# Altium schematic sheet CH32X035F8U-R0.SchDoc
size 304 x 254 mm
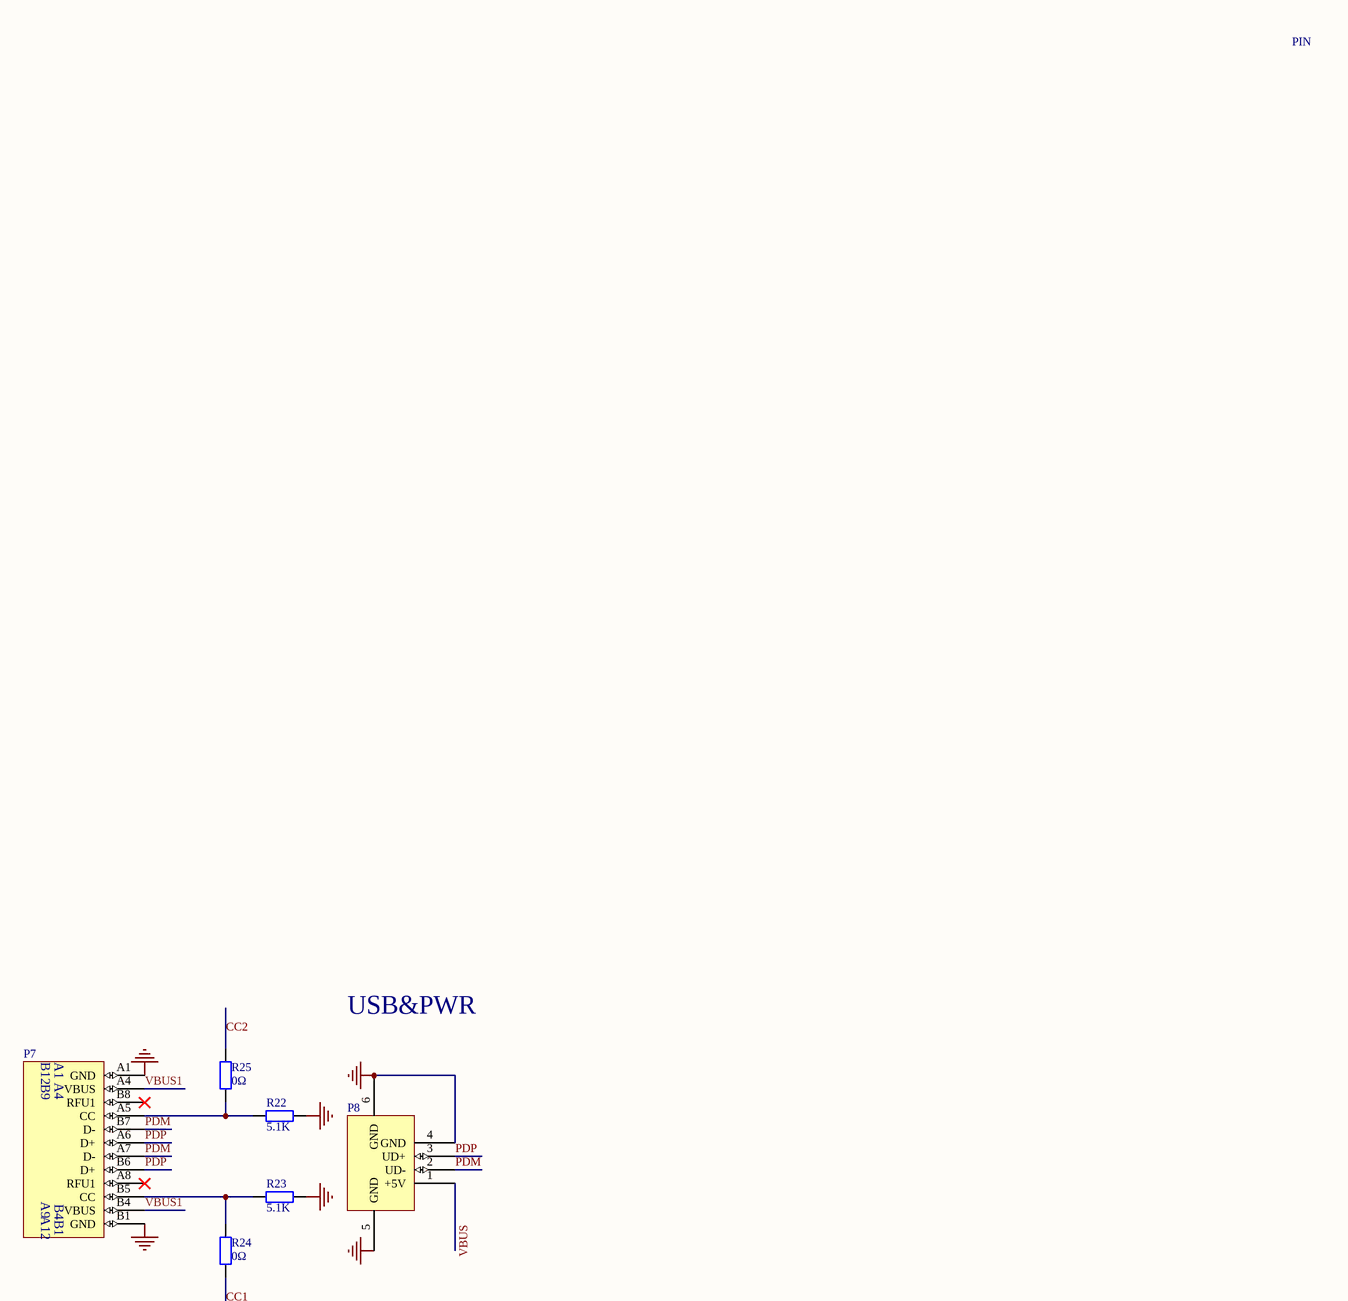
[diagram p0: CH32X035F8U-R0.SchDoc, top right]
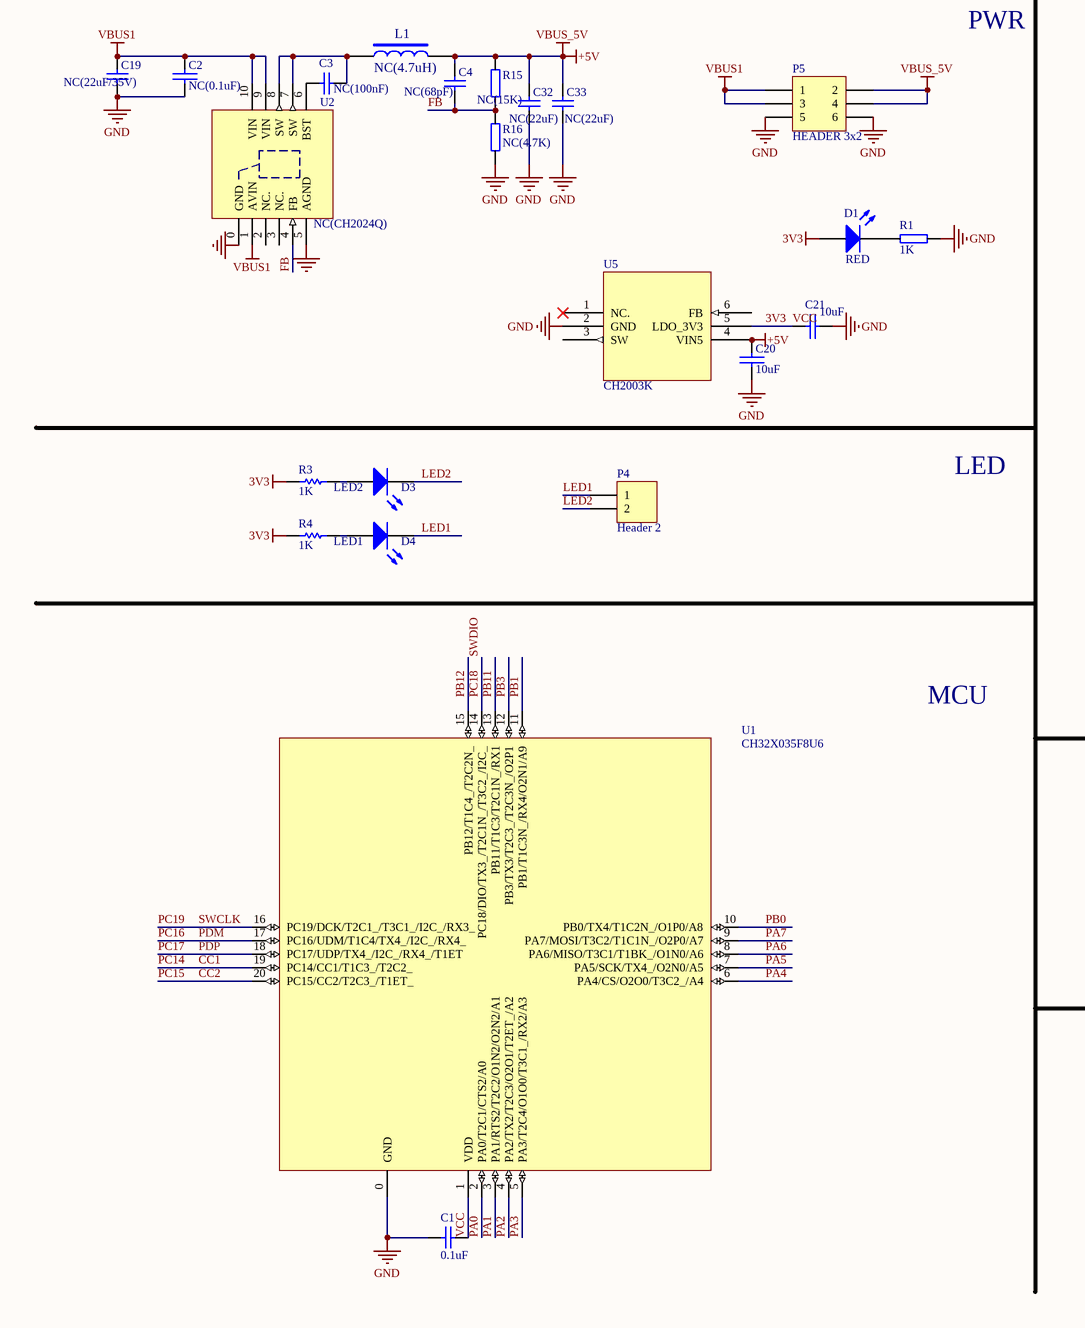
[diagram p1: CH32X035F8U-R0.SchDoc, bottom left]
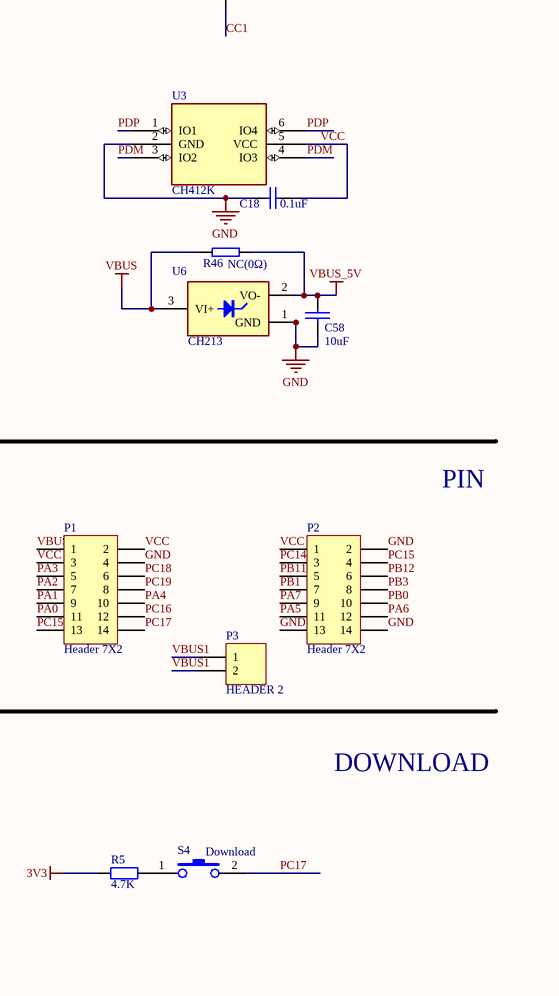
[diagram p2: CH32X035F8U-R0.SchDoc, bottom right]

## Parts
C1  0.1uF  [0402_C]
C2  NC(0.1uF)  [0402_C]
C3  NC(100nF)  [0402_C]
C4  NC(68pF)  [0402_C]
C18  0.1uF  [0402_C]
C19  NC(22uF/35V)  [0805_C]
C20  10uF  [0603_C]
C21  10uF  [0603_C]
C32  NC(22uF)  [0805_C]
C33  NC(22uF)  [0805_C]
C58  10uF  [0603_C]
D1  RED  [0603+]
D3  LED2  [0603+]
D4  LED1  [0603+]
L1  NC(4.7uH)  [IND-SMD_L7.0-W6.6]
P1  Header 7X2  [IDC14-2.54mm]
P2  Header 7X2  [IDC14-2.54mm]
P3  HEADER 2  [SIP2-2.54mm]
P4  Header 2  [SIP2-2.54mm]
P5  HEADER 3x2  [IDC6-2.54mm]
P7  TYPE-C  [TYPE-C-Receptacle-2.0]  (value not drawn)
P8  USB_A  [USBAF]  (value not drawn)
R1  1K  [0402]
R3  1K  [0402]
R4  1K  [0402]
R5  4.7K  [0402]
R15  NC(15K)  [0402]
R16  NC(4.7K)  [0402]
R22  5.1K  [0402]
R23  5.1K  [0402]
R24  0Ω  [0402]
R25  0Ω  [0402]
R46  NC(0Ω)  [0402]
S4  Download  [SMD_6.1x3.65x2.5mm-KEY]
U1  CH32X035F8U6  [QFN20_3X3]
U2  NC(CH2024Q)  [DFN10_3X3]
U3  CH412K  [SOT-363]
U5  CH2003K  [SOT-23-6]
U6  CH213  [SOT-23-3]

## Nets
3V3: C1.1 C18.2 C21.2 D1.1(A) P1.2 P1.3 P2.1 R3.1 R4.1 R5.1 U1.1(VDD) U3.5(VCC) U5.5(LDO_3V3)  [also labelled VCC]
+5V: C4.1 C20.2 C32.2 C33.2 C58.1 L1.2 P5.2 P5.4 R15.2 R46.1 U5.4(VIN5) U6.2(VO-)  [also labelled VBUS_5V]
GND: C1.2 C2.1 C18.1 C19.1 C20.1 C21.1 C32.1 C33.1 C58.2 P1.4 P2.2 P2.13 P2.14 P5.5 P5.6 P7.A1(GND) P7.B1(GND) P8.4(GND) P8.5(GND) P8.6(GND) R1.2 R16.1 R22.2 R23.2 U1.0(GND) U2.0(GND) U2.5(AGND) U3.2(GND) U5.2(GND) U6.1(GND)
VBUS: P1.1 P8.1(+5V) R46.2 U6.3(VI+)
VBUS1: C2.2 C19.2 P3.1 P3.2 P5.1 P5.3 P7.A4(VBUS) P7.B4(VBUS) U2.1(AVIN) U2.9(VIN) U2.10(VIN)
CC1: P2.3 R24.1 U1.19(PC14/CC1/T1C3_/T2C2_)  [also labelled PC14]
CC2: P1.13 P2.4 R25.2 U1.20(PC15/CC2/T2C3_/T1ET_)  [also labelled PC15]
FB: C4.2 R15.1 R16.2 U2.4(FB)
LED1: D4.2(K) P4.1
LED2: D3.2(K) P4.2
PA0: P1.11 U1.2(PA0/T2C1/CTS2/A0)
PA1: P1.9 U1.3(PA1/RTS2/T2C2/O1N2/O2N2/A1)
PA2: P1.7 U1.4(PA2/TX2/T2C3/O2O1/T2ET_/A2)
PA3: P1.5 U1.5(PA3/T2C4/O1O0/T3C1_/RX2/A3)
PA4: P1.10 U1.6(PA4/CS/O2O0/T3C2_/A4)
PA5: P2.11 U1.7(PA5/SCK/TX4_/O2N0/A5)
PA6: P2.12 U1.8(PA6/MISO/T3C1/T1BK_/O1N0/A6)
PA7: P2.9 U1.9(PA7/MOSI/T3C2/T1C1N_/O2P0/A7)
PB0: P2.10 U1.10(PB0/TX4/T1C2N_/O1P0/A8)
PB1: P2.7 U1.11(PB1/T1C3N_/RX4/O2N1/A9)
PB3: P2.8 U1.12(PB3/TX3/T2C3_/T2C3N_/O2P1)
PB11: P2.5 U1.13(PB11/T1C3/T2C1N_/RX1)
PB12: P2.6 U1.15(PB12/T1C4_/T2C2N_)
PC16: P1.12 P7.A7(D-) P7.B7(D-) P8.2(UD-) U1.17(PC16/UDM/T1C4/TX4_/I2C_/RX4_) U3.3(IO2) U3.4(IO3)  [also labelled PDM]
PC17: P1.14 P7.A6(D+) P7.B6(D+) P8.3(UD+) S4.2 U1.18(PC17/UDP/TX4_/I2C_/RX4_/T1ET) U3.1(IO1) U3.6(IO4)  [also labelled PDP]
PC18: P1.6 U1.14(PC18/DIO/TX3_/T2C1N_/T3C2_/I2C_)  [also labelled SWDIO]
PC19: P1.8 U1.16(PC19/DCK/T2C1_/T3C1_/I2C_/RX3_)  [also labelled SWCLK]
NetC3_1: C3.1 U2.6(BST)
NetC3_2: C3.2 L1.1 U2.7(SW) U2.8(SW)
NetD1_2: D1.2(K) R1.1
NetD3_1: D3.1(A) R3.2
NetD4_1: D4.1(A) R4.2
NetP7_A5: P7.A5(CC) R22.1 R25.1
NetP7_B5: P7.B5(CC) R23.1 R24.2
NetR5_2: R5.2 S4.1

Not connected (* = marked no-connect by the designer): P7 A8(RFU1)* B8(RFU1)*; U2 2(NC.) 3(NC.); U5 1(NC.)* 3(SW) 6(FB)

## Notes on the sheet
- PIN
- PWR
- USB&PWR
- LED
- MCU
- DOWNLOAD
- (in symbol TYPE-C1) B12; B9; A9; A12

## Library data of the parts
C1 C18 = Cap: Capacitor
C2 C20 C21 C58 = CAP: Capacitor
C3 = 0603 1uF (105) 10% 50V: 贴片电容; ComponentLink1Description: 供应商链接; ComponentLink1URL: http://www.szlcsc.com/product/details_16531.html; Package: 0603; Supplier: LC; SuppliersPartNumber: C15849
C4 C19 C32 C33 = 0603 100nF (104) 10% 50V: 贴片电容; ComponentLink1Description: 供应商链接; ComponentLink1URL: http://www.szlcsc.com/product/details_15331.html; Package: 0603; Supplier: LC; SuppliersPartNumber: C14663
D1 D3 D4 = LED0: Typical INFRARED GaAs LED; Published: 8-Jun-2000; LatestRevisionDate: 08-Jul-2005; LatestRevisionNote: Mech Layer 1 removed.; PackageReference: LED-0; Publisher: Altium Limited
  D1: PackageDescription: LED; 2 Leads
L1 = INDUCTOR
P1 P2 = Header 7X2: Header, 7-Pin, Dual row; LatestRevisionDate: 17-Jul-2002; LatestRevisionNote: Re-released for DXP Platform.; Publisher: Altium Limited
P3 = HEADER 2: Header, 2-Pin
P4 = Header 2: Header, 2-Pin; LatestRevisionDate: 17-Jul-2002; LatestRevisionNote: Re-released for DXP Platform.; Publisher: Altium Limited
P5 = HEADER 3x2: Header, 3-Pin, Dual row
P7 = TYPE-C1
P8 = USB: USB Port
R1 R15 R16 R46 = RES
R3 R4 = Res Semi: Semiconductor Resistor; Published: 8-Jun-2000; LatestRevisionDate: 17-Jul-2002; LatestRevisionNote: Re-released for DXP Platform.; PackageReference: AXIAL-0.5; Publisher: Altium Limited; Value: 1K
R5 R22-R25 = Res2: Resistor
S4 = KEY1
U1 = CH32X035F8U6: RISC-V MCU with USB/PD/ADC/SPI/I2C/UART/OA
U2 = CH2024Q: Step-Down DC-DC Converter, 28V input, FB 1.2V, 3A output
U3 = CH412K: Qaud ESD protect, high speed
U5 = CH2003K: Step-Down DC-DC Converter, 5V input, FB 0.6V, 800mA output, with LDO 3.3V * 200mA
U6 = CH213E: Ideal Diode 5V*1A